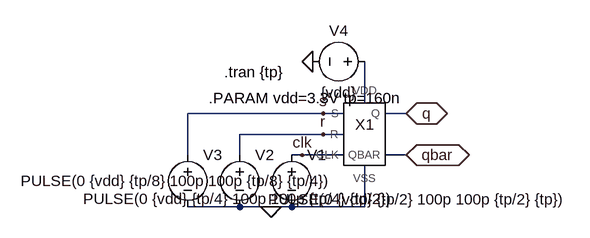
[diagram p0: schematic sr_flipflop_tb.asc]
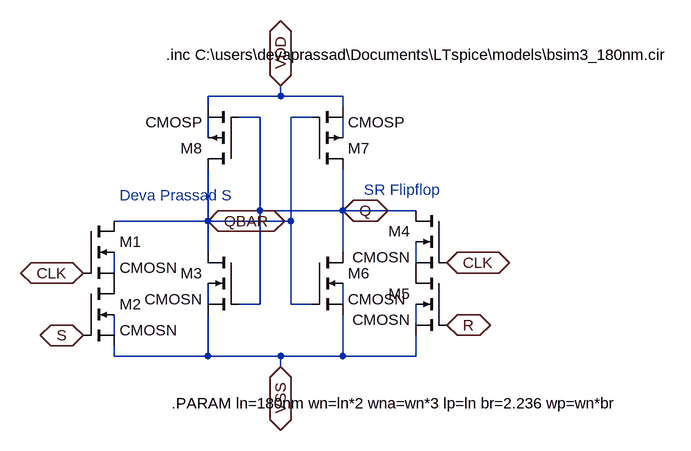
[diagram p1: sub-circuit sr_flipflop.asc]
sr_flipflop_tb.asc, the LTspice schematic file:
Version 4.1
SHEET 1 880 680
WIRE 192 112 192 48
WIRE 128 128 -80 128
WIRE 160 128 128 128
WIRE 256 128 224 128
WIRE 128 160 0 160
WIRE 160 160 128 160
WIRE -80 192 -80 128
WIRE 0 192 0 160
WIRE 96 192 80 192
WIRE 160 192 96 192
WIRE 256 192 224 192
WIRE 0 272 -80 272
WIRE 48 272 0 272
WIRE 80 272 48 272
WIRE 192 272 192 208
WIRE 192 272 80 272
FLAG 48 272 0
FLAG 112 48 0
FLAG 256 128 q
IOPIN 256 128 BiDir
FLAG 256 192 qbar
IOPIN 256 192 BiDir
FLAG 128 128 s
FLAG 128 160 r
FLAG 96 192 clk
SYMBOL diglib\\flipflop1x\\sr_flipflop 192 176 R0
SYMATTR InstName X1
SYMBOL voltage 80 176 R0
WINDOW 3 -36 84 Left 2
WINDOW 123 0 0 Left 0
WINDOW 39 0 0 Left 0
SYMATTR InstName V1
SYMATTR Value PULSE(0 {vdd} {tp/2} 100p 100p {tp/2} {tp})
SYMBOL voltage 0 176 R0
WINDOW 3 -241 83 Left 2
WINDOW 123 0 0 Left 0
WINDOW 39 0 0 Left 0
SYMATTR InstName V2
SYMATTR Value PULSE(0 {vdd} {tp/4} 100p 100p {tp/4} {tp/2})
SYMBOL voltage -80 176 R0
WINDOW 3 -257 56 Left 2
WINDOW 123 0 0 Left 0
WINDOW 39 0 0 Left 0
SYMATTR InstName V3
SYMATTR Value PULSE(0 {vdd} {tp/8} 100p 100p {tp/8} {tp/4})
SYMBOL voltage 208 48 R90
WINDOW 0 -32 56 VBottom 2
WINDOW 3 32 56 VTop 2
SYMATTR InstName V4
SYMATTR Value {vdd}
TEXT -48 104 Left 2 !.PARAM vdd=3.3V tp=160n
TEXT -24 64 Left 2 !.tran {tp}

sr_flipflop.asc, the sub-circuit schematic file:
Version 4.1
SHEET 1 880 680
WIRE 352 -80 352 -96
WIRE 352 -80 240 -80
WIRE 448 -80 352 -80
WIRE 240 -64 240 -80
WIRE 448 -64 448 -80
WIRE 320 -48 288 -48
WIRE 400 -48 368 -48
WIRE 240 -16 240 -48
WIRE 448 -16 448 -48
WIRE 320 96 320 -48
WIRE 448 96 448 32
WIRE 448 96 320 96
WIRE 560 96 448 96
WIRE 240 112 240 32
WIRE 240 112 96 112
WIRE 368 112 368 -48
WIRE 368 112 240 112
WIRE 240 160 240 112
WIRE 448 160 448 96
WIRE 560 176 560 144
WIRE 96 192 96 160
WIRE 240 240 240 208
WIRE 320 240 320 96
WIRE 320 240 288 240
WIRE 368 240 368 112
WIRE 400 240 368 240
WIRE 448 240 448 208
WIRE 560 272 560 240
WIRE 96 288 96 256
WIRE 96 320 96 304
WIRE 240 320 240 256
WIRE 240 320 96 320
WIRE 352 320 240 320
WIRE 448 320 448 256
WIRE 448 320 352 320
WIRE 560 320 560 288
WIRE 560 320 448 320
WIRE 352 336 352 320
FLAG 352 336 VSS
IOPIN 352 336 BiDir
FLAG 48 192 CLK
IOPIN 48 192 BiDir
FLAG 48 288 S
IOPIN 48 288 BiDir
FLAG 608 272 R
IOPIN 608 272 BiDir
FLAG 608 176 CLK
IOPIN 608 176 BiDir
FLAG 352 -96 VDD
IOPIN 352 -96 BiDir
FLAG 448 96 Q
IOPIN 448 96 BiDir
FLAG 240 112 QBAR
IOPIN 240 112 BiDir
SYMBOL nmos4 48 112 R0
SYMATTR InstName M1
SYMATTR Value CMOSN
SYMATTR Value2 l={ln} w={wna} ad={ln*wna} as={ln*wna} pd={2*ln+wna} ps={2*ln+wna}
SYMBOL nmos4 288 160 M0
SYMATTR InstName M3
SYMATTR Value CMOSN
SYMATTR Value2 l={ln} w={wn} ad={ln*wn} as={ln*wn} pd={2*ln+wn} ps={2*ln+wn}
SYMBOL nmos4 608 192 M0
SYMATTR InstName M5
SYMATTR Value CMOSN
SYMATTR Value2 l={ln} w={wna} ad={ln*wna} as={ln*wna} pd={2*ln+wna} ps={2*ln+wna}
SYMBOL nmos4 400 160 R0
SYMATTR InstName M6
SYMATTR Value CMOSN
SYMATTR Value2 l={ln} w={wn} ad={ln*wn} as={ln*wn} pd={2*ln+wn} ps={2*ln+wn}
SYMBOL pmos4 400 32 M180
SYMATTR InstName M7
SYMATTR Value CMOSP
SYMATTR Value2 l={lp} w={wp} ad={lp*wp} as={lp*wp} pd={2*lp+wp} ps={2*lp+wp}
SYMBOL pmos4 288 32 R180
SYMATTR InstName M8
SYMATTR Value CMOSP
SYMATTR Value2 l={lp} w={wp} ad={lp*wp} as={lp*wp} pd={2*lp+wp} ps={2*lp+wp}
SYMBOL nmos4 48 208 R0
SYMATTR InstName M2
SYMATTR Value CMOSN
SYMATTR Value2 l={ln} w={wna} ad={ln*wna} as={ln*wna} pd={2*ln+wna} ps={2*ln+wna}
SYMBOL nmos4 608 96 M0
SYMATTR InstName M4
SYMATTR Value CMOSN
SYMATTR Value2 l={ln} w={wna} ad={ln*wna} as={ln*wna} pd={2*ln+wna} ps={2*ln+wna}
TEXT 176 -144 Left 2 !.inc C:\\users\\devaprassad\\Documents\\LTspice\\models\\bsim3_180nm.cir
TEXT 184 392 Left 2 !.PARAM ln=180nm wn=ln*2 wna=wn*3 lp=ln br=2.236 wp=wn*br
TEXT 104 72 Left 2 ;Deva Prassad S
TEXT 480 64 Left 2 ;SR Flipflop

The netlist it stands for:
* sr_flipflop_tb.asc
X§X1 clk q qbar r s N001 0 sr_flipflop
V1 clk 0 PULSE(0 {vdd} {tp/2} 100p 100p {tp/2} {tp})
V2 r 0 PULSE(0 {vdd} {tp/4} 100p 100p {tp/4} {tp/2})
V3 s 0 PULSE(0 {vdd} {tp/8} 100p 100p {tp/8} {tp/4})
V4 N001 0 {vdd}

* block symbol definitions
.subckt sr_flipflop CLK Q QBAR R S VDD VSS
M1 QBAR CLK P001 N004 CMOSN l={ln} w={wna} ad={ln*wna} as={ln*wna} pd={2*ln+wna} ps={2*ln+wna}
M3 QBAR Q VSS N005 CMOSN l={ln} w={wn} ad={ln*wn} as={ln*wn} pd={2*ln+wn} ps={2*ln+wn}
M5 P002 R VSS N007 CMOSN l={ln} w={wna} ad={ln*wna} as={ln*wna} pd={2*ln+wna} ps={2*ln+wna}
M6 Q QBAR VSS N006 CMOSN l={ln} w={wn} ad={ln*wn} as={ln*wn} pd={2*ln+wn} ps={2*ln+wn}
M7 Q QBAR VDD N002 CMOSP l={lp} w={wp} ad={lp*wp} as={lp*wp} pd={2*lp+wp} ps={2*lp+wp}
M8 QBAR Q VDD N001 CMOSP l={lp} w={wp} ad={lp*wp} as={lp*wp} pd={2*lp+wp} ps={2*lp+wp}
M2 P001 S VSS N008 CMOSN l={ln} w={wna} ad={ln*wna} as={ln*wna} pd={2*ln+wna} ps={2*ln+wna}
M4 Q CLK P002 N003 CMOSN l={ln} w={wna} ad={ln*wna} as={ln*wna} pd={2*ln+wna} ps={2*ln+wna}
.inc C:\users\devaprassad\Documents\LTspice\models\bsim3_180nm.cir
.PARAM ln=180nm wn=ln*2 wna=wn*3 lp=ln br=2.236 wp=wn*br
* Deva Prassad S
* SR Flipflop
.ends sr_flipflop

.model NMOS NMOS
.model PMOS PMOS
.lib standard.mos
.PARAM vdd=3.3V tp=160n
.tran {tp}
.backanno
.end